# Altium schematic sheet 04 Sensing.SchDoc
size A4; SheetNumber: 4; SheetTotal: 4
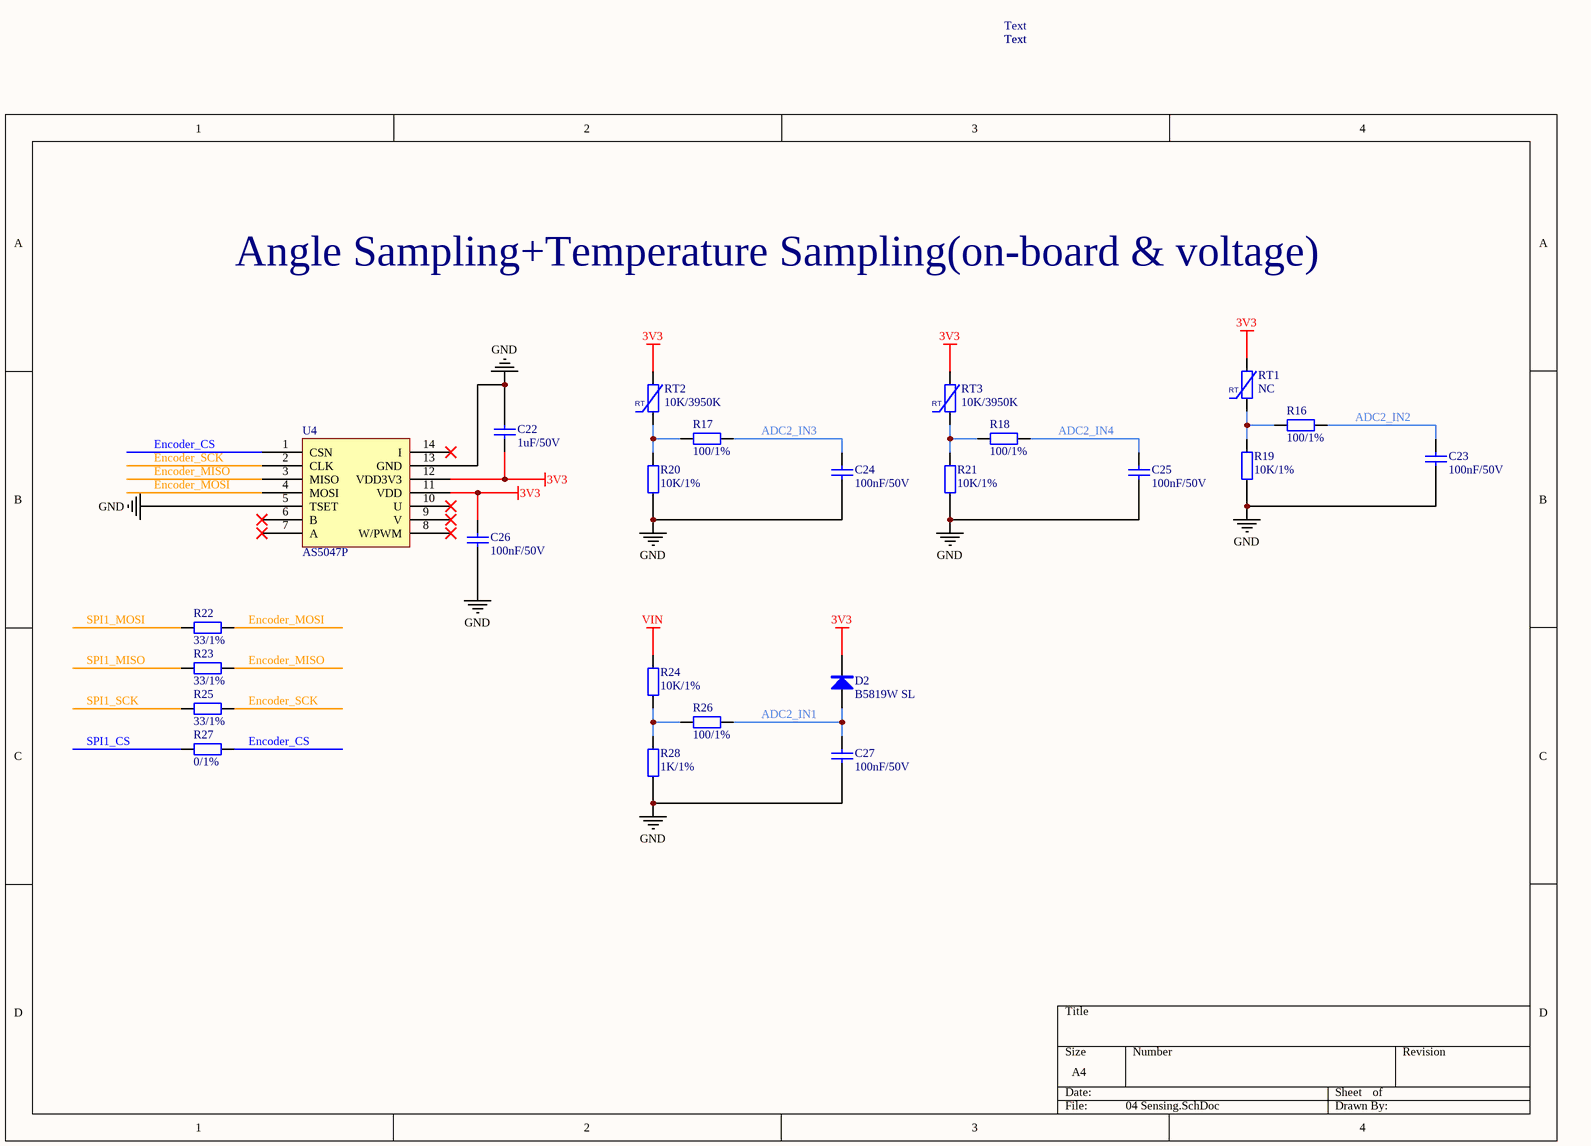
[diagram p0: 04 Sensing.SchDoc]

## Parts
C22  1uF/50V  [C0603_L]
C23  100nF/50V  [C0603_L]
C24  100nF/50V  [C0603_L]
C25  100nF/50V  [C0603_L]
C26  100nF/50V  [C0603_L]
C27  100nF/50V  [C0603_L]
D2  B5819W SL  [SOD-123]
R16  100/1%  [R0603_L]
R17  100/1%  [R0603_L]
R18  100/1%  [R0603_L]
R19  10K/1%  [R0603_L]
R20  10K/1%  [R0603_L]
R21  10K/1%  [R0603_L]
R22  33/1%  [R0603_L]
R23  33/1%  [R0603_L]
R24  10K/1%  [R0603_L]
R25  33/1%  [R0603_L]
R26  100/1%  [R0603_L]
R27  0/1%  [R0603_L]
R28  1K/1%  [R0603_L]
RT1  NC  [R0805-HP_L]
RT2  10K/3950K  [R0805-HP_L]
RT3  10K/3950K  [R0805-HP_L]
U4  AS5047P  [TSSOP14_L]

## Nets
3V3: C22.2 C26.1 D2.2(K) RT1.2 RT2.2 RT3.2 U4.11(VDD) U4.12(VDD3V3)
GND: C22.1 C23.2 C24.2 C25.2 C26.2 C27.2 R19.1 R20.1 R21.1 R28.1 U4.5(TSET) U4.13(GND)
VIN: R24.2
ADC2_IN1: C27.1 D2.1(A) R26.2
ADC2_IN2: C23.1 R16.2
ADC2_IN3: C24.1 R17.2
ADC2_IN4: C25.1 R18.2
Encoder_CS: R27.1 U4.1(CSN)
Encoder_MISO: R23.1 U4.3(MISO)
Encoder_MOSI: R22.1 U4.4(MOSI)
Encoder_SCK: R25.1 U4.2(CLK)
SPI1_CS: R27.2
SPI1_MISO: R23.2
SPI1_MOSI: R22.2
SPI1_SCK: R25.2
NetR16_1: R16.1 R19.2 RT1.1
NetR17_1: R17.1 R20.2 RT2.1
NetR18_1: R18.1 R21.2 RT3.1
NetR24_1: R24.1 R26.1 R28.2

Not connected (* = marked no-connect by the designer): U4 6(B)* 7(A)* 8(W/PWM)* 9(V)* 10(U)* 14(I)*

## Notes on the sheet
- Text
- Angle Sampling+Temperature Sampling(on-board & voltage)

## Library data of the parts
C22 = C: CL10A105KB8NNNC; BOM名称: 无极性贴片电容; 联系卖家，免费查找封装: 唯一出售店铺网址https://shop463601444.taobao.com
C23-C27 = C: CC0603KRX7R9BB104; BOM名称: 无极性贴片电容; 联系卖家，免费查找封装: 唯一出售店铺网址https://shop463601444.taobao.com
D2 = 1N4007: BOM名称: 整流二极管; 联系卖家，免费查找封装: 唯一出售店铺网址https://shop463601444.taobao.com
R16-R18 R26 = R: 0603WAF1000T5E; BOM名称: 贴片电阻; 联系卖家，免费查找封装: 唯一出售店铺网址https://shop463601444.taobao.com
R19-R21 R24 = R: 0603WAF1002T5E; BOM名称: 贴片电阻; 联系卖家，免费查找封装: 唯一出售店铺网址https://shop463601444.taobao.com
R22 R23 R25 = R: 0603WAF330JT5E; BOM名称: 贴片电阻; 联系卖家，免费查找封装: 唯一出售店铺网址https://shop463601444.taobao.com
R27 = R: 0603WAF0000T5E; BOM名称: 贴片电阻; 联系卖家，免费查找封装: 唯一出售店铺网址https://shop463601444.taobao.com
R28 = R: 0603WAF1001T5E; BOM名称: 贴片电阻; 联系卖家，免费查找封装: 唯一出售店铺网址https://shop463601444.taobao.com
RT1 = RT: MF52D 103F3435-100; BOM名称: 压敏电阻; 联系卖家，免费查找封装: 唯一出售店铺网址https://shop463601444.taobao.com
RT2 RT3 = RT: SDNT2012X103F3950FTF; BOM名称: 压敏电阻; 联系卖家，免费查找封装: 唯一出售店铺网址https://shop463601444.taobao.com
U4 = AS5047P: 14 Bit编码器